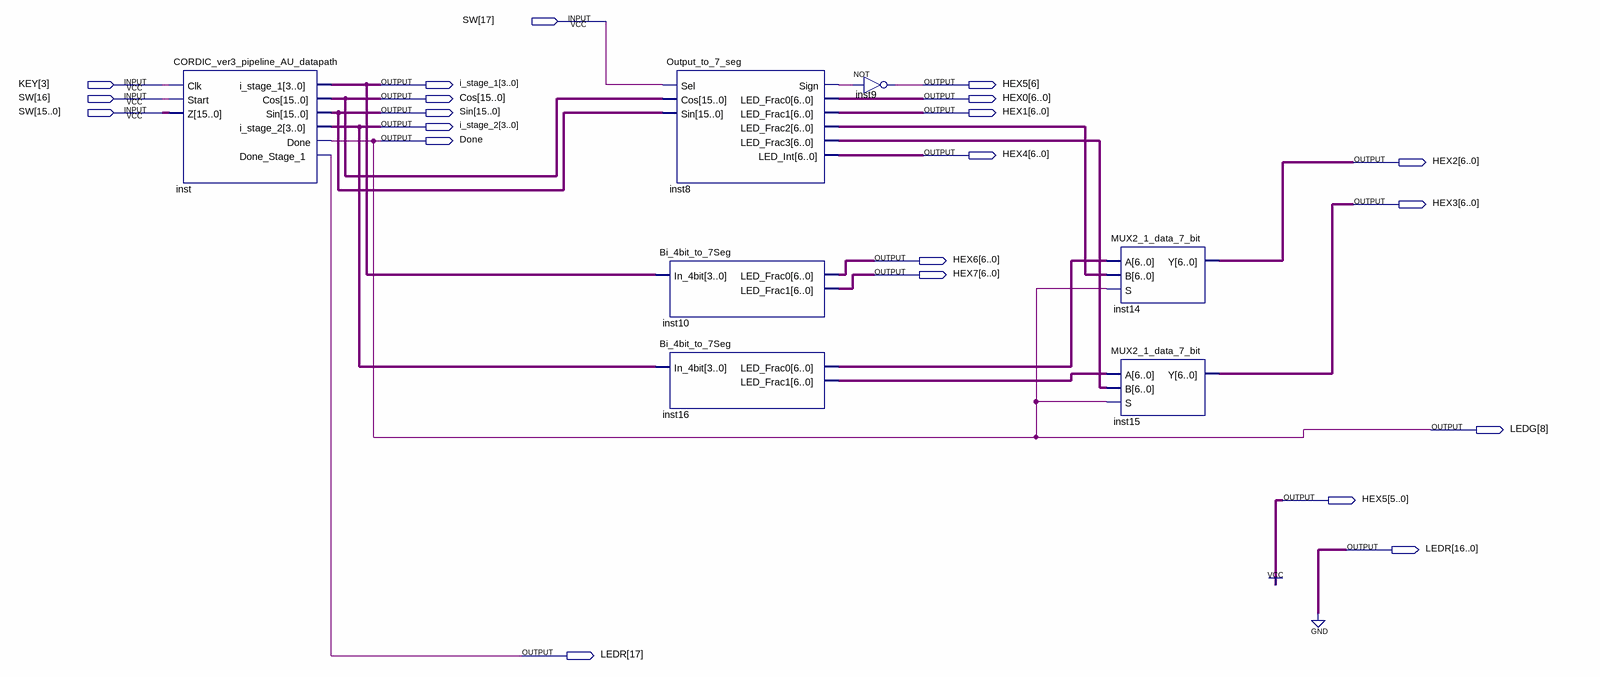
[diagram p0: schematic sheet]
// Quartus schematic CORDIC_ver3_pipeline_AU_datapath_KIT.bdf as structural Verilog: 7 symbols, 21 pins
module CORDIC_ver3_pipeline_AU_datapath_KIT (
  input  [17:0] SW,
  input  [3:3] KEY,
  output [3:0] i_stage_1,
  output [6:0] HEX5,
  output [15:0] Cos,
  output [6:0] HEX0,
  output [15:0] Sin,
  output [6:0] HEX1,
  output [3:0] i_stage_2,
  output Done,
  output [6:0] HEX4,
  output [6:0] HEX2,
  output [6:0] HEX3,
  output [6:0] HEX6,
  output [6:0] HEX7,
  output [8:8] LEDG,
  output [17:0] LEDR
);

  wire inst8_sign;
  wire [6:0] inst8_led_frac2, inst8_led_frac3, inst16_led_frac0, inst16_led_frac1;

  CORDIC_ver3_pipeline_AU_datapath inst (
    .Clk(KEY[3]), .Start(SW[16]), .Z(SW[15:0]), .i_stage_1(i_stage_1), .Cos(Cos), .Sin(Sin),
    .i_stage_2(i_stage_2), .Done(Done), .Done_Stage_1(LEDR[17]));
  Output_to_7_seg inst8 (
    .Sel(SW[17]), .Cos(Cos), .Sin(Sin), .Sign(inst8_sign), .LED_Frac0(HEX0), .LED_Frac1(HEX1),
    .LED_Frac2(inst8_led_frac2), .LED_Frac3(inst8_led_frac3), .LED_Int(HEX4));
  Bi_4bit_to_7Seg inst10 (.In_4bit(i_stage_1), .LED_Frac0(HEX6), .LED_Frac1(HEX7));
  Bi_4bit_to_7Seg inst16 (.In_4bit(i_stage_2), .LED_Frac0(inst16_led_frac0), .LED_Frac1(inst16_led_frac1));
  not inst9 (HEX5[6], inst8_sign);
  MUX2_1_data_7_bit inst14 (.A(inst16_led_frac0), .B(inst8_led_frac2), .S(Done), .Y(HEX2));
  MUX2_1_data_7_bit inst15 (.A(inst16_led_frac1), .B(inst8_led_frac3), .S(Done), .Y(HEX3));

  assign HEX5[5:0] = {6{1'b1}};
  assign LEDG[8] = Done;
  assign LEDR[16:0] = {17{1'b0}};
endmodule
